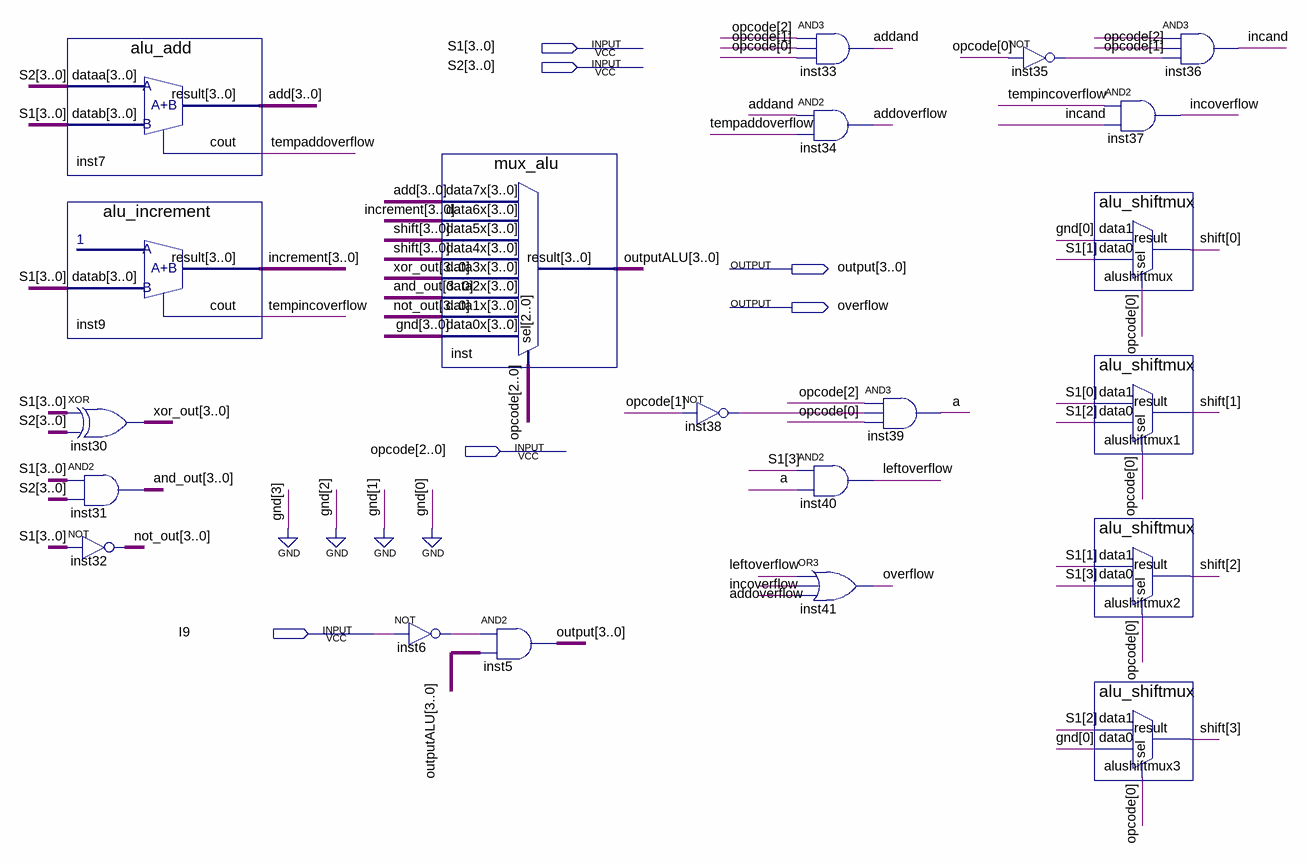
[diagram p0: schematic sheet]
// Quartus schematic alu_group37.bdf as structural Verilog: 21 symbols, 6 pins
module alu_group37 (
  input  [3:0] S1,
  input  [3:0] S2,
  input  [2:0] opcode,
  input  I9,
  output [3:0] \output ,
  output overflow
);

  wire a, addand, addoverflow, incand, incoverflow, inst6_out, inst35_out, inst38_out, leftoverflow,
       tempaddoverflow, tempincoverflow;
  wire [3:0] add, and_out, increment, not_out, outputALU, shift, xor_out;

  alu_add inst7 (.dataa(S2), .datab(S1), .result(add), .cout(tempaddoverflow));
  alu_increment inst9 (.datab(S1), .result(increment), .cout(tempincoverflow));
  assign xor_out = S1 ^ S2;  // XOR inst30, 4 bits wide
  assign and_out = S1 & S2;  // AND2 inst31, 4 bits wide
  assign not_out = ~S1;  // NOT inst32, 4 bits wide
  mux_alu inst (
    .data7x(add), .data6x(increment), .data5x(shift), .data4x(shift), .data3x(xor_out), .data2x(and_out),
    .data1x(not_out), .data0x(4'b0000), .sel(opcode), .result(outputALU));
  not inst6 (inst6_out, I9);
  assign \output  = {4{inst6_out}} & outputALU;  // AND2 inst5, 4 bits wide
  not inst38 (inst38_out, opcode[1]);
  and inst33 (addand, opcode[2], opcode[1], opcode[0]);
  and inst34 (addoverflow, addand, tempaddoverflow);
  and inst40 (leftoverflow, S1[3], a);
  or inst41 (overflow, leftoverflow, incoverflow, addoverflow);
  and inst39 (a, opcode[2], inst38_out, opcode[0]);
  not inst35 (inst35_out, opcode[0]);
  and inst37 (incoverflow, tempincoverflow, incand);
  alu_shiftmux alushiftmux (.data1(1'b0), .data0(S1[1]), .sel(opcode[0]), .result(shift[0]));
  alu_shiftmux alushiftmux1 (.data1(S1[0]), .data0(S1[2]), .sel(opcode[0]), .result(shift[1]));
  alu_shiftmux alushiftmux2 (.data1(S1[1]), .data0(S1[3]), .sel(opcode[0]), .result(shift[2]));
  alu_shiftmux alushiftmux3 (.data1(S1[2]), .data0(1'b0), .sel(opcode[0]), .result(shift[3]));
  and inst36 (incand, opcode[2], opcode[1], inst35_out);
endmodule
